# Altium project CH582M_USB_DONGLE.PrjPcb
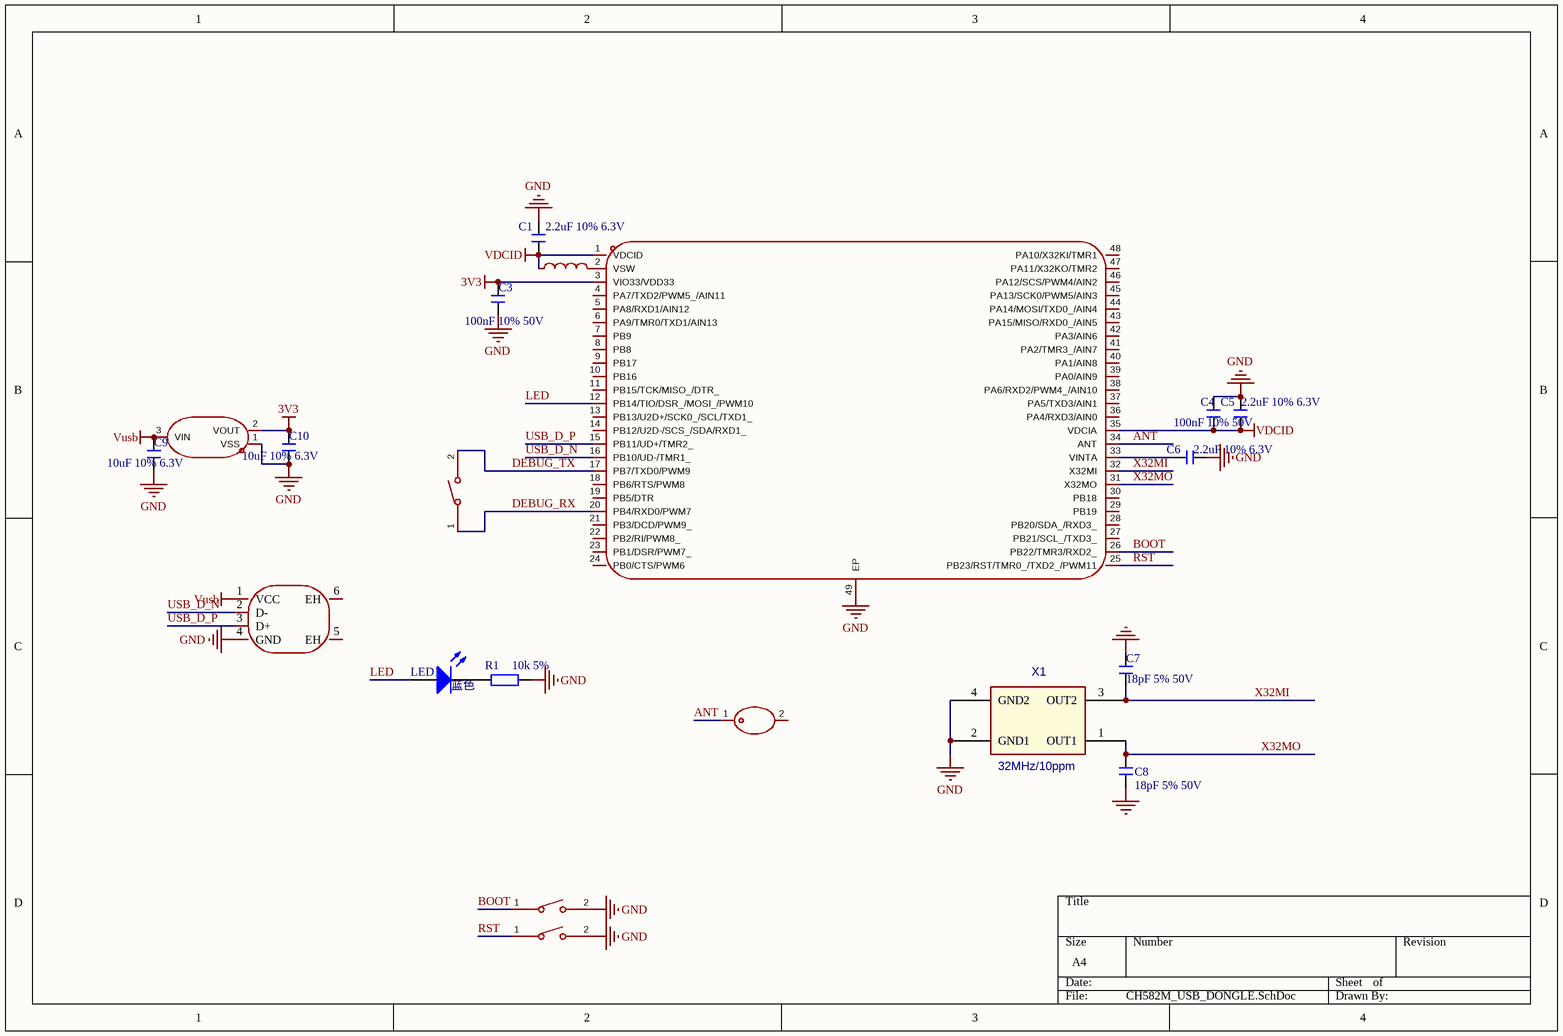
[diagram p0: CH582M_USB_DONGLE.SchDoc]
1 sheet, 20 parts. Net scope: global (net labels, ports and power ports of the same name join across sheets).
Board file: CH582M_USB_DONGLE.PcbDoc

## Sheet CH582M_USB_DONGLE.SchDoc
size A4; SheetNumber: 1; SheetTotal: 1

### Parts
C1  2.2uF 10% 6.3V  [C0402_L]
C3  100nF 10% 50V  [C0402_L]
C4  100nF 10% 50V  [C0402_L]
C5  2.2uF 10% 6.3V  [C0402_L]
C6  2.2uF 10% 6.3V  [C0402_L]
C7  18pF 5% 50V  [C0402_L]
C8  18pF 5% 50V  [C0402_L]
C9  10uF 10% 6.3V  [C0402_L]
C10  10uF 10% 6.3V  [C0402_L]
L1  ftc252012s100mbca  [IND-SMD_L2.5-W2.0]  (value not drawn)
L2  rfeca3216060a1t  [ANT-SMD_L3.1-W1.6]  (value not drawn)
LED1  蓝色  [LED0603-FD]
R1  10k 5%  [R0402_L]
SW1  ts-1088-ar02016  [SW-SMD_L3.9-W3.0-P4.45]  (value not drawn)
SW2  ts-1088-ar02016  [SW-SMD_L3.9-W3.0-P4.45]  (value not drawn)
SW3  ts-1088-ar02016  [SW-SMD_L3.9-W3.0-P4.45]  (value not drawn)
U1  ch582m  [QFN-48_L5.0-W5.0-P0.35-BL-EP]  (value not drawn)
U2  662k.  [SOT-23-3_L2.9-W1.3-P1.90-LS2.4-BR]  (value not drawn)
USB1  USB-05  [USB-A-TH_USB-05]  (value not drawn)
X1  32MHz/10ppm  [OSC-3225-4P]

### Nets
3V3: C3.1 C10.2 U1.3(VIO33/VDD33) U2.2(VOUT)
GND: C1.2 C3.2 C4.2 C5.1 C6.1 C7.1 C8.1 C9.1 C10.1 R1.1 SW1.2 SW2.2 U1.49(EP) U2.1(VSS) USB1.4(GND) X1.2(GND1) X1.4(GND2)
VDCID: C1.1 C4.1 C5.2 L1.2 U1.1(VDCID) U1.35(VDCIA)
Vusb: C9.2 U2.3(VIN) USB1.1(VCC)
ANT: L2.1 U1.34(ANT)
BOOT: SW1.1 U1.26(PB22/TMR3/RXD2_)
DEBUG_RX: SW3.1 U1.20(PB4/RXD0/PWM7)
DEBUG_TX: SW3.2 U1.17(PB7/TXD0/PWM9)
LED: LED1.1(A) U1.12(PB14/TIO/DSR_/MOSI_/PWM10)
RST: SW2.1 U1.25(PB23/RST/TMR0_/TXD2_/PWM11)
USB_D_N: U1.16(PB10/UD-/TMR1_) USB1.2(D-)
USB_D_P: U1.15(PB11/UD+/TMR2_) USB1.3(D+)
X32MI: C7.2 U1.32(X32MI) X1.3(OUT2)
X32MO: C8.2 U1.31(X32MO) X1.1(OUT1)
NetC6_2: C6.2 U1.33(VINTA)
NetL1_1: L1.1 U1.2(VSW)
NetLED1_2: LED1.2(K) R1.2

Not connected (* = marked no-connect by the designer): L2 2; U1 4(PA7/TXD2/PWM5_/AIN11) 5(PA8/RXD1/AIN12) 6(PA9/TMR0/TXD1/AIN13) 7(PB9) 8(PB8) 9(PB17) 10(PB16) 11(PB15/TCK/MISO_/DTR_) 13(PB13/U2D+/SCK0_/SCL/TXD1_) 14(PB12/U2D-/SCS_/SDA/RXD1_) 18(PB6/RTS/PWM8) 19(PB5/DTR) 21(PB3/DCD/PWM9_) 22(PB2/RI/PWM8_) 23(PB1/DSR/PWM7_) 24(PB0/CTS/PWM6) 27(PB21/SCL_/TXD3_) 28(PB20/SDA_/RXD3_) 29(PB19) 30(PB18) 36(PA4/RXD3/AIN0) 37(PA5/TXD3/AIN1) 38(PA6/RXD2/PWM4_/AIN10) 39(PA0/AIN9) 40(PA1/AIN8) 41(PA2/TMR3_/AIN7) 42(PA3/AIN6) 43(PA15/MISO/RXD0_/AIN5) 44(PA14/MOSI/TXD0_/AIN4) 45(PA13/SCK0/PWM5/AIN3) 46(PA12/SCS/PWM4/AIN2) 47(PA11/X32KO/TMR2) 48(PA10/X32KI/TMR1); USB1 5(EH) 6(EH)

### Library data of the parts
C1 C3-C10 = C: 贴片电容; BOM名称: 无极性贴片电容; 优秀评价可免费更新: 联系淘宝ID：黄晶宝石，获取更新版封装库; 卖家免费技术支持，联系售后: 唯一出售店铺网址https://shop463601444.taobao.com; 本封装库来自淘宝卖家 ID：黄晶宝石: 其他店铺购入均为盗版，请立即申请退款
L1 = ftc252012s100mbca: 电感值:10uH;精度:±20%;额定电流:1.2A;饱和电流(Isat):1.6A;类型:一体成型电感;; Manufacturer: cjiang(长江微电); AddInBom: yes; ModelId: 85d117b4abb34d9087271edcd9ba0330; ModelName: IND-SMD_L2.5-W2.0-H1.2; ModelTransform: 99.2124,78.74,0,0,0,0,0,0,0; Value: 10uH; Tolerance: ±20%; Rated Current: 1.2A; Saturation Current (Isat): 1.6A; DC Resistance (DCR): 330mΩ; Type: 一体成型电感; Symbol: FTC252012S100MBCA; LCSC Part Name: 10uH ±20% 1.6A; SupplierPart: C5832376; ManufacturerPart: FTC252012S100MBCA; Supplier Footprint: SMD,2x2.5mm; JLCPCB Part Class: Extended Part; Datasheet: https://atta.szlcsc.com/upload/public/pdf/source/20230602/8FFEDA9C0247A92A0D4B67554BFE4091.pdf; Supplier: LCSC; ConvertToPcb: yes; FootprintName: IND-SMD_L2.5-W2.0
L2 = rfeca3216060a1t: 天线类型:陶瓷天线;中心频点:2.4GHz;带宽:-;峰值增益:2dBi;极化方式:-;功率容量:-;驻波比:2.1;; Manufacturer: Walsin(华新科); AddInBom: yes; ModelId: fe75f6c932bd483aac67fd9557788572; ModelName: ANT-SMD_L3.1-W1.6-H0.6; ModelTransform: 122.047,62.992,0,0,0,0,-0.0005,0,0; Antenna Type: 陶瓷天线; Central Frequency: 2.4GHz; Peak Gain: 2dBi; VSWR: 2.1; Symbol: RFECA3216060A1T; LCSC Part Name: 2.4 GHz ISM频段工作频率的陶瓷天线; SupplierPart: C127620; ManufacturerPart: RFECA3216060A1T; Supplier Footprint: 1206; JLCPCB Part Class: Extended Part; Datasheet: https://atta.szlcsc.com/upload/public/pdf/source/20180326/C127620_3C564CCA307EE04222EAFCE04B7FD99A.pdf; Supplier: LCSC; ConvertToPcb: yes; FootprintName: ANT-SMD_L3.1-W1.6; Bandwidth: -; Polarization Type: -; Impedance: -; Power capacity: -; Operating Temperature: -
LED1 = LED: 贴片LED; 封装库来自淘宝卖家：黄晶宝石: 其他店铺购入均为盗版封装库，无更新权益，请立即申请退款，本店现金奖励200~1000元; BOM名称: 贴片LED
R1 = R: 贴片电阻; 优秀评价可免费更新: 联系淘宝ID：黄晶宝石，获取更新版封装库; 卖家免费技术支持，联系售后: 唯一出售店铺网址https://shop463601444.taobao.com; 本封装库来自淘宝卖家 ID：黄晶宝石: 其他店铺购入均为盗版，请立即申请退款; BOM名称: 贴片电阻
SW1-SW3 = ts-1088-ar02016: 电路结构:单刀单掷;按钮形状:圆形按钮;作用力:1.6N;安装方式:立贴;开关长度:3.9mm;开关宽度:3mm;开关高度:2mm;带支架:不带支架;触点电流:50mA;额定电压:12V;带灯:-;工作寿命:10万次;; Manufacturer: XUNPU(讯普); AddInBom: yes; ModelId: b26698b69f274ffabef8a26c7d0e5dd1; ModelName: SW-SMD_L3.9-W2.9-H2.0-LS4.8; ModelTransform: 188.976,114.174,0,0,0,0,0,0,0; Circuit: 单刀单掷; Actuator Style: 圆形按钮; Operating Force: 1.6N; Switch Height: 2mm; with Bracket: 不带支架; Contact Current: 50mA; Voltage Rating: 12V; Actuator/Cap Color: 黑色; Life: 10万次; Symbol: TS-1088-AR02016; LCSC Part Name: 3.9*3*2mm 立贴 轻触开关; SupplierPart: C720477; ManufacturerPart: TS-1088-AR02016; Supplier Footprint: SMD,4x3mm; JLCPCB Part Class: Basic Part; Datasheet: https://item.szlcsc.com/datasheet/TS-1088-AR02016/763484.html; Supplier: LCSC; ConvertToPcb: yes; FootprintName: SW-SMD_L3.9-W3.0-P4.45; Mounting Type: 立贴; Length: 3.9mm; Width: 3mm; With Lamp: -; IP Rating: -; Termination Style: SMD接片; Operating Temperature: -30℃~+80℃
U1 = ch582m: CPU内核:RISC-V;程序存储容量:512KB;RAM总容量:32KB;GPIO端口数量:40;工作电压范围:2.3V~3.6V;CPU最大主频:80MHz;程序存储器类型:FLASH;; Manufacturer: WCH(南京沁恒); AddInBom: yes; ModelId: 4b8d4b49de7e447b9d591de0c72709ce; ModelTransform: 197.6374,197.6374,0,270,0,0,0,0,0; CPU Core: RISC-V; Program Storage Size: 512KB; RAM Size: 32KB; GPIO Ports Number: 40; CPU Maximum Speed: 80MHz; Program Memory Type: FLASH; ADC (Bit): 12bit; PWM (Bit): 26bit; 32Bit Timer: 4; I2C: 1; SPI: 2; Symbol: CH582M; LCSC Part Name: CH582M; SupplierPart: C2920766; ManufacturerPart: CH582M; Supplier Footprint: QFN-48-EP(5x5); JLCPCB Part Class: Extended Part; Datasheet: https://atta.szlcsc.com/upload/public/pdf/source/20220111/7785F6388C97C318998CCEA67CDD9164.pdf; Supplier: LCSC; ConvertToPcb: yes; FootprintName: QFN-48_L5.0-W5.0-P0.35-BL-EP; ModelName: QFN-48_L5.0-W5.0-P0.35-BL-EP; Operating Voltage Range: 2.3V~3.6V; Operating Temperature Range: -40℃~+85℃; DAC (Bit): -; 8Bit Timer: -; 16Bit Timer: -; CAN: -; UART/USART: 4; I2S: -; Universal Serial Bus: -; Internal Comparator: -; Peripheral/Function: -; communication protocol: -; Watchdog: -; Real-Time Clock: -; Infrared Data Association: -; Low-Voltage Detect: -; CCP Capture/Compare: -; Secure Digital Input and Output: -; Direct Memory Access: -; Internal Oscillator: -
U2 = 662k.: 输出极性:正极;工作电压:6V;输出电压:3.3V;输出电流:300mA;电源纹波抑制比(PSRR):-;输出类型:固定;; Manufacturer: FM(富满); AddInBom: yes; ModelId: c62791f0466c4ae2a892c056b845b0ca; ModelName: SOT-23-3P_L2.9-W1.3-H1.0-LS2.4-P0.95; ModelTransform: 98.425,114.173,0,180,0,0,0.0005,-0.0005,0; Output Configuration: 正极; Voltage - Supply: 6V; Output Voltage: 3.3V; Output Current: 300mA; Voltage Dropout: 40mV@(30mA); standby current: 10uA; Output Type: 固定; Number of Outputs: 1; Symbol: 662K.; LCSC Part Name: 3.3V 300mA 6V; SupplierPart: C841298; ManufacturerPart: 662K.; Supplier Footprint: SOT-23-3; JLCPCB Part Class: Extended Part; Datasheet: https://item.szlcsc.com/datasheet/662K./898173.html; Supplier: LCSC; ConvertToPcb: yes; FootprintName: SOT-23-3_L2.9-W1.3-P1.90-LS2.4-BR; Power Supply Rejection Ratio (PSRR): -; Noise: -; Features: 短路保护; Operating Temperature: -40℃~+130℃@(Tj)
USB1 = USB-05: Manufacturer: SOFNG(硕方); Add into BOM: yes; Connector Type: Type-A; Gender: 公; Number of Contacts: 4P; Number of Ports: 1; Symbol: USB-05; Device: USB-05; LCSC Part Name: Type-A 公; Supplier Part: C112454; Manufacturer Part: USB-05; Supplier Footprint: 插件; JLCPCB Part Class: Extended Part; Datasheet: https://atta.szlcsc.com/upload/public/pdf/source/20220615/298FC7EF95355C4E82516C7899B405E9.pdf; Supplier: LCSC; Convert to PCB: yes; Standard: USB 2.0; Current Rating - Power (Max): -
X1 = OSC44M_5: 晶振